# Altium schematic sheet TopLevel.SchDoc
size A4; SheetNumber: 1; SheetTotal: 5
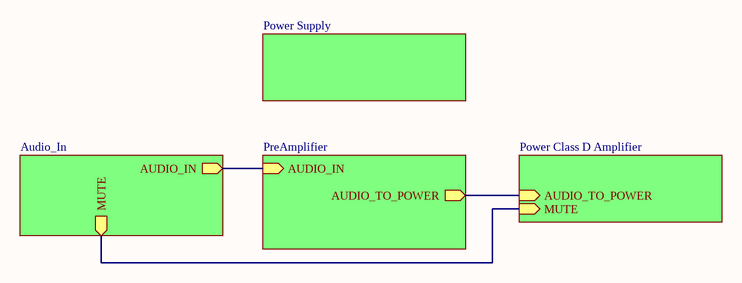
[diagram p0: TopLevel.SchDoc]

## Sub-sheets
Audio_In = Audi_In.SchDoc: MUTE (out), AUDIO_IN (out)
Power Class D Amplifier = PowerStage.SchDoc: MUTE (in), AUDIO_TO_POWER (in)
Power Supply = PowerSupply.SchDoc: no entries
PreAmplifier = PreAmli.SchDoc: AUDIO_IN (in), AUDIO_TO_POWER (out)

## Nets
(unnamed): sheet PreAmplifier/AUDIO_IN, sheet Audio_In/AUDIO_IN
(unnamed): sheet PreAmplifier/AUDIO_TO_POWER, sheet Power Class D Amplifier/AUDIO_TO_POWER
(unnamed): sheet Audio_In/MUTE, sheet Power Class D Amplifier/MUTE